# Altium schematic sheet MCU.SchDoc
size A3; SheetNumber: 6; SheetTotal: 9
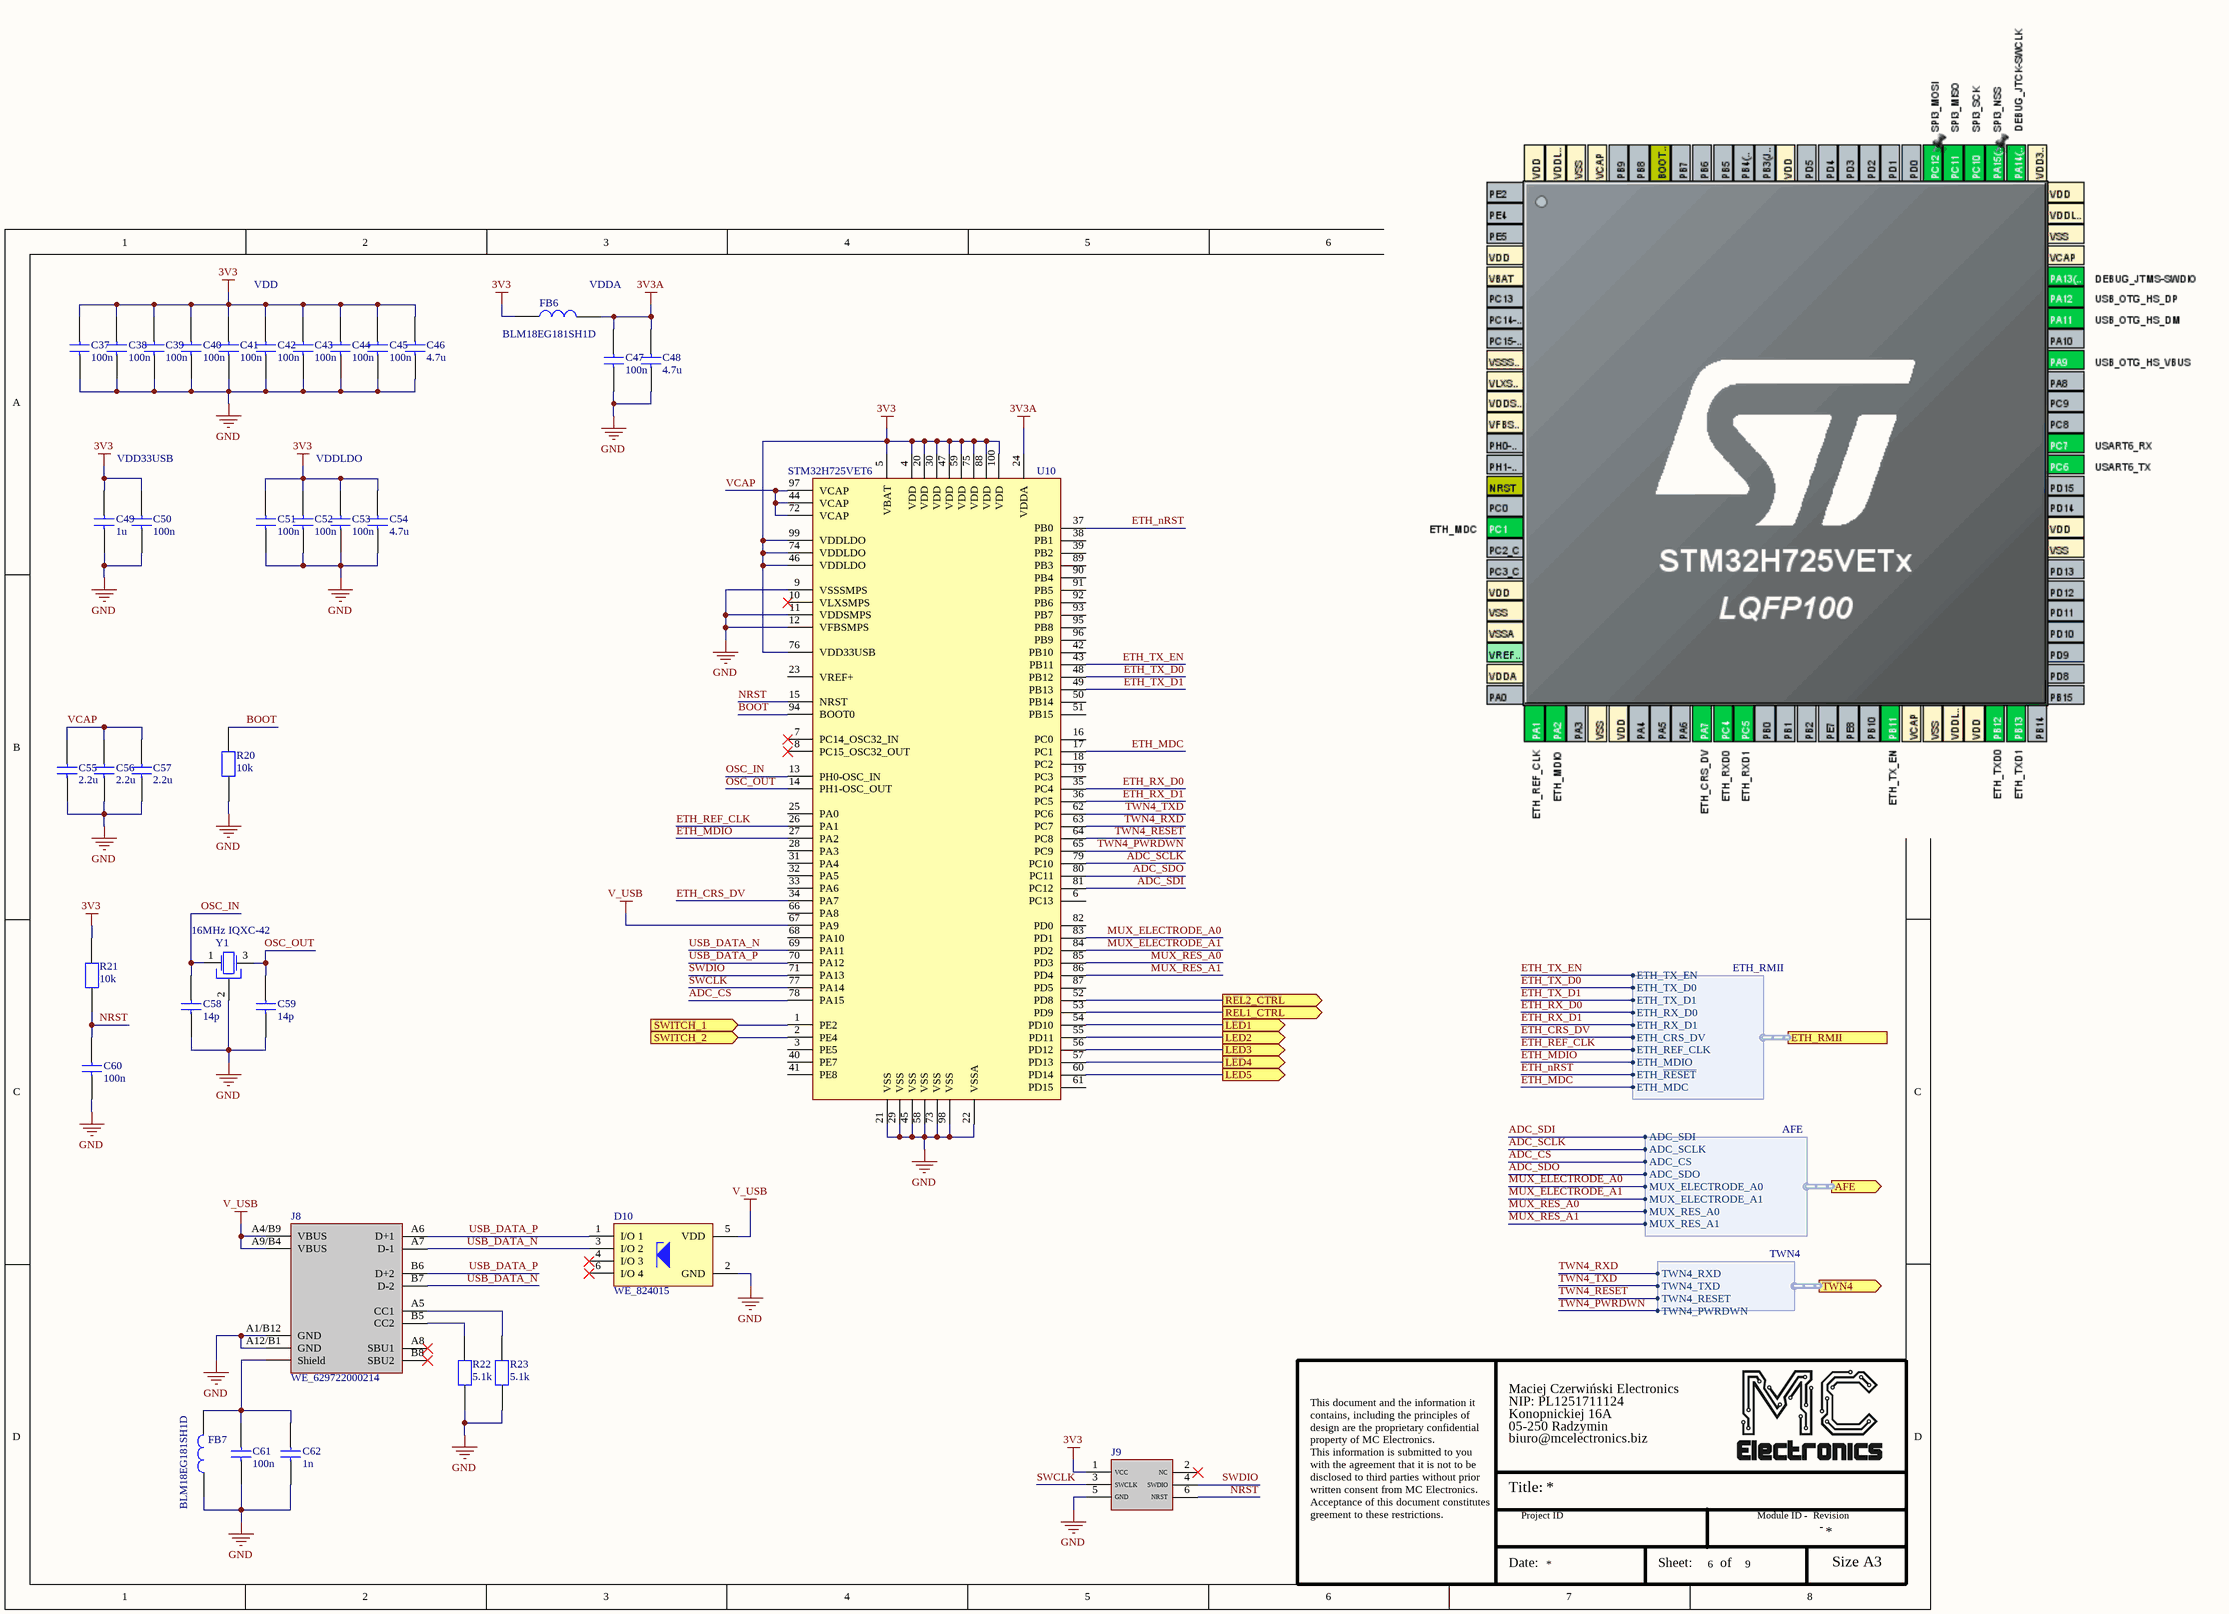
[diagram p0: MCU.SchDoc]

## Parts
C37  value 100n  [0603C]  (hidden comment: 100nF 50V X7R 10%)
C38  value 100n  [0603C]  (hidden comment: 100nF 50V X7R 10%)
C39  value 100n  [0603C]  (hidden comment: 100nF 50V X7R 10%)
C40  value 100n  [0603C]  (hidden comment: 100nF 50V X7R 10%)
C41  value 100n  [0603C]  (hidden comment: 100nF 50V X7R 10%)
C42  value 100n  [0603C]  (hidden comment: 100nF 50V X7R 10%)
C43  value 100n  [0603C]  (hidden comment: 100nF 50V X7R 10%)
C44  value 100n  [0603C]  (hidden comment: 100nF 50V X7R 10%)
C45  value 100n  [0603C]  (hidden comment: 100nF 50V X7R 10%)
C46  value 4.7u  [0603C]  (hidden comment: 4.7uF 16V X5R 10%)
C47  value 100n  [0603C]  (hidden comment: 100nF 50V X7R 10%)
C48  value 4.7u  [0603C]  (hidden comment: 4.7uF 16V X5R 10%)
C49  value 1u  [0603C]  (hidden comment: 1uF 16V X5R 10%)
C50  value 100n  [0603C]  (hidden comment: 100nF 50V X7R 10%)
C51  value 100n  [0603C]  (hidden comment: 100nF 50V X7R 10%)
C52  value 100n  [0603C]  (hidden comment: 100nF 50V X7R 10%)
C53  value 100n  [0603C]  (hidden comment: 100nF 50V X7R 10%)
C54  value 4.7u  [0603C]  (hidden comment: 4.7uF 16V X5R 10%)
C55  value 2.2u  [0603C]  (hidden comment: 2.2uF 16V X5R 10%)
C56  value 2.2u  [0603C]  (hidden comment: 2.2uF 16V X5R 10%)
C57  value 2.2u  [0603C]  (hidden comment: 2.2uF 16V X5R 10%)
C58  value 14p  [0402C]  (hidden comment: 14pF 50V C0G 2%)
C59  value 14p  [0402C]  (hidden comment: 14pF 50V C0G 2%)
C60  value 100n  [0603C]  (hidden comment: 100nF 50V X7R 10%)
C61  value 100n  [0603C]  (hidden comment: 100nF 50V X7R 10%)
C62  value 1n  [0603C]  (hidden comment: 1nF 50V X7R 10%)
D10  WE_824015  [SOT95P280X110-6N]
FB6  BLM18EG181SH1D  [0603FB]
FB7  BLM18EG181SH1D  [0603FB]
J8  WE_629722000214  [Wurth 629722000214]
J9  STM programming connector large  [STM programming connector 2.54mm]  (value not drawn)
R20  value 10k  [0603R]  (hidden comment: 10k 1% 0.1W)
R21  value 10k  [0603R]  (hidden comment: 10k 1% 0.1W)
R22  value 5.1k  [0603R]  (hidden comment: 5.1k 1% 0.1W)
R23  value 5.1k  [0603R]  (hidden comment: 5.1k 1% 0.1W)
U10  STM32H725VET6  [TSQFP-LQFP50P1600X1600X160-100N]
Y1  16MHz IQXC-42  [Quartz crystal 4pin 2x1.6mm]

## Ports
AFE (out, harness AFE), ETH_RMII (harness ETH_RMII), LED1 (out), LED2 (out), LED3 (out), LED4 (out), LED5 (out), REL1_CTRL (out), REL2_CTRL (out), SWITCH_1 (in), SWITCH_2 (in), TWN4 (out, harness TWN4)

## Harnesses
ETH_RMII: ETH_MDIO, ETH_~{RESET}, ETH_CRS_DV, ETH_RX_D1, ETH_RX_D0, ETH_TX_D1, ETH_TX_D0, ETH_TX_EN, ETH_REF_CLK, ETH_MDC
TWN4: TWN4_RXD, TWN4_TXD, TWN4_RESET, TWN4_PWRDWN
AFE: ADC_SDI, ADC_SCLK, ADC_CS, ADC_SDO, MUX_ELECTRODE_A1, MUX_RES_A0, MUX_RES_A1, MUX_ELECTRODE_A0

## Nets
3V3: C37.2 C38.2 C39.2 C40.2 C41.2 C42.2 C43.2 C44.2 C45.2 C46.2 C49.2 C50.2 C51.2 C52.2 C53.2 C54.2 FB6.1 J9.1(VCC) R21.1 U10.4(VDD) U10.5(VBAT) U10.20(VDD) U10.30(VDD) U10.46(VDDLDO) U10.47(VDD) U10.59(VDD) U10.74(VDDLDO) U10.75(VDD) U10.76(VDD33USB) U10.88(VDD) U10.99(VDDLDO) U10.100(VDD)
3V3A: C47.2 C48.2 FB6.2 U10.24(VDDA)
GND: C37.1 C38.1 C39.1 C40.1 C41.1 C42.1 C43.1 C44.1 C45.1 C46.1 C47.1 C48.1 C49.1 C50.1 C51.1 C52.1 C53.1 C54.1 C55.1 C56.1 C57.1 C58.1 C59.1 C60.1 C61.1 C62.1 D10.2(GND) FB7.1 J8.A1/B12(GND) J8.A12/B1(GND) J9.5(GND) R20.2 R22.2 R23.2 U10.9(VSSSMPS) U10.11(VDDSMPS) U10.12(VFBSMPS) U10.21(VSS) U10.22(VSSA) U10.29(VSS) U10.45(VSS) U10.58(VSS) U10.73(VSS) U10.98(VSS) Y1.2(GND)
V_USB: D10.5(VDD) J8.A4/B9(VBUS) J8.A9/B4(VBUS) U10.67(PA9)
ADC_CS: U10.78(PA15) ; port AFE.ADC_CS
ADC_SCLK: U10.79(PC10) ; port AFE.ADC_SCLK
ADC_SDI: U10.81(PC12) ; port AFE.ADC_SDI
ADC_SDO: U10.80(PC11) ; port AFE.ADC_SDO
BOOT: R20.1 U10.94(BOOT0)
ETH_CRS_DV: U10.34(PA7) ; port ETH_RMII.ETH_CRS_DV
ETH_MDC: U10.17(PC1) ; port ETH_RMII.ETH_MDC
ETH_MDIO: U10.27(PA2) ; port ETH_RMII.ETH_MDIO
ETH_nRST: U10.37(PB0) ; port ETH_RMII.ETH_~{RESET}
ETH_REF_CLK: U10.26(PA1) ; port ETH_RMII.ETH_REF_CLK
ETH_RX_D0: U10.35(PC4) ; port ETH_RMII.ETH_RX_D0
ETH_RX_D1: U10.36(PC5) ; port ETH_RMII.ETH_RX_D1
ETH_TX_D0: U10.48(PB12) ; port ETH_RMII.ETH_TX_D0
ETH_TX_D1: U10.49(PB13) ; port ETH_RMII.ETH_TX_D1
ETH_TX_EN: U10.43(PB11) ; port ETH_RMII.ETH_TX_EN
LED1: U10.54(PD10) ; port LED1
LED2: U10.55(PD11) ; port LED2
LED3: U10.56(PD12) ; port LED3
LED4: U10.57(PD13) ; port LED4
LED5: U10.60(PD14) ; port LED5
MUX_ELECTRODE_A0: U10.83(PD1) ; port AFE.MUX_ELECTRODE_A0
MUX_ELECTRODE_A1: U10.84(PD2) ; port AFE.MUX_ELECTRODE_A1
MUX_RES_A0: U10.85(PD3) ; port AFE.MUX_RES_A0
MUX_RES_A1: U10.86(PD4) ; port AFE.MUX_RES_A1
NRST: C60.2 J9.6(NRST) R21.2 U10.15(NRST)
OSC_IN: C58.2 U10.13(PH0-OSC_IN) Y1.1(Crystal)
OSC_OUT: C59.2 U10.14(PH1-OSC_OUT) Y1.3(Crystal)
REL1_CTRL: U10.53(PD9) ; port REL1_CTRL
REL2_CTRL: U10.52(PD8) ; port REL2_CTRL
SWCLK: J9.3(SWCLK) U10.77(PA14)
SWDIO: J9.4(SWDIO) U10.71(PA13)
SWITCH_1: U10.1(PE2) ; port SWITCH_1
SWITCH_2: U10.2(PE4) ; port SWITCH_2
TWN4_PWRDWN: U10.65(PC9) ; port TWN4.TWN4_PWRDWN
TWN4_RESET: U10.64(PC8) ; port TWN4.TWN4_RESET
TWN4_RXD: U10.63(PC7) ; port TWN4.TWN4_RXD
TWN4_TXD: U10.62(PC6) ; port TWN4.TWN4_TXD
USB_DATA_N: D10.3(I/O_2) J8.A7(D-1) J8.B7(D-2) U10.69(PA11)
USB_DATA_P: D10.1(I/O_1) J8.A6(D+1) J8.B6(D+2) U10.70(PA12)
VCAP: C55.2 C56.2 C57.2 U10.44(VCAP) U10.72(VCAP) U10.97(VCAP)
NetC61_2: C61.2 C62.2 FB7.2 J8.Shell(Shield)
NetJ8_A5: J8.A5(CC1) R23.1
NetJ8_B5: J8.B5(CC2) R22.1

Not connected (* = marked no-connect by the designer): D10 4(I/O_3)* 6(I/O_4)*; J8 A8(SBU1)* B8(SBU2)*; J9 2(NC)*; U10 3(PE5) 6(PC13) 7(PC14_OSC32_IN)* 8(PC15_OSC32_OUT)* 10(VLXSMPS)* 16(PC0) 18(PC2) 19(PC3) 23(VREF+) 25(PA0) 28(PA3) 31(PA4) 32(PA5) 33(PA6) 38(PB1) 39(PB2) 40(PE7) 41(PE8) 42(PB10) 50(PB14) 51(PB15) 61(PD15) 66(PA8) 68(PA10) 82(PD0) 87(PD5) 89(PB3) 90(PB4) 91(PB5) 92(PB6) 93(PB7) 95(PB8) 96(PB9)

## Notes on the sheet
- VDD
- (near FB6) VDDA
- VDD33USB
- VDDLDO
- This document and the information it
- contains, including the principles of
- design are the proprietary confidential
- property of MC Electronics.
- Maciej Czerwiński Electronics
- NIP: PL1251711124
- Konopnickiej 16A
- 05-250 Radzymin
- biuro@mcelectronics.biz
- This information is submitted to you
- with the agreement that it is not to be
- disclosed to third parties without prior
- written consent from MC Electronics.
- Acceptance of this document constitutes
- Title:
- greement to these restrictions.
- Date:
- Project ID
- Sheet:
- of
- Module ID -
- Revision
- -
- Size A3

## Library data of the parts
C37-C45 C47 C50-C53 C60 C61 = GEN_100nF_50V_X7R_10%_0603: Generic capacitor 100n 0603; MC_ID: C00001; Generic: Yes; Mount type: SMT
C46 C48 C54 = GEN_4.7uF_16V_X5R_10%_0603: Generic capacitor 4.7u 0603; MC_ID: C00066; Generic: Yes; Mount type: SMT
C49 = GEN_1uF_16V_X5R_10%_0603: Generic capacitor 1u 0603; Generic: Yes; MC_ID: C00017; Mount type: SMT
C55-C57 = GEN_2.2uF_16V_X5R_10%_0603: Generic capacitor 2.2u 0603; MC_ID: C00065; Generic: Yes; Mount type: SMT
C58 C59 = GEN_14pF_50V_C0G_2%_0402: Generic capacitor 14p 0402; Generic: Yes; MC_ID: C00085; Mount type: SMT
C62 = GEN_1nF_50V_X7R_10%_0603: Generic capacitor 1nF 50V 0603; MC_ID: C00024; Generic: Yes; Mount type: SMT
D10 = WE_824015: TVS for ethernet and USB 2.0; MC_ID: TVS00028; Generic: No; Mount type: SMT; Specific PN: WE_824015
FB6 FB7 = BLM18EG181SH1D: Ferrite bead 0603 1A 50mOhm, 1MHz - 180Ohm; Generic: No; MC_ID: FB00019; Specific PN: BLM18EG181SH1D; Mount type: SMT
J8 = WE_629722000214: Wurth USB C 2.0 connector; Generic: No; MC_ID: CON000211; Specific PN: WE_629722000214; Mount type: SMT
J9 = STM programming connector large: STM MC programming connector large; Generic: No; MC_ID: CON00192/CON00239; Specific PN: 90130-1106; Mount type: THT
R20 R21 = GEN_10k_1%_0.1W_0603: Generic resistor 10k 0603; MC_ID: R00003; Generic: Yes; Mount type: SMT
R22 R23 = GEN_5.1k_1%_0.1W_0603: Generic resistor 5.1k 0603; Generic: Yes; MC_ID: R00007; Mount type: SMT
U10 = STM32H725VET6: STM32H725VET6 microcontroller; MC_ID: xx; Generic: No; Mount type: SMT; Specific PN: STM32H725VET6
Y1 = 16MHz IQXC-42: Quarz oscilator 16MHz 2x1.6x0.5mm; MC_ID: XTA00010; Specific PN: WE_830108288709; Generic: No; Mount type: SMT